# Altium schematic sheet MCU, 3.3V LDO & SUPPORT.SchDoc
size A; SheetNumber: 1; SheetTotal: 5
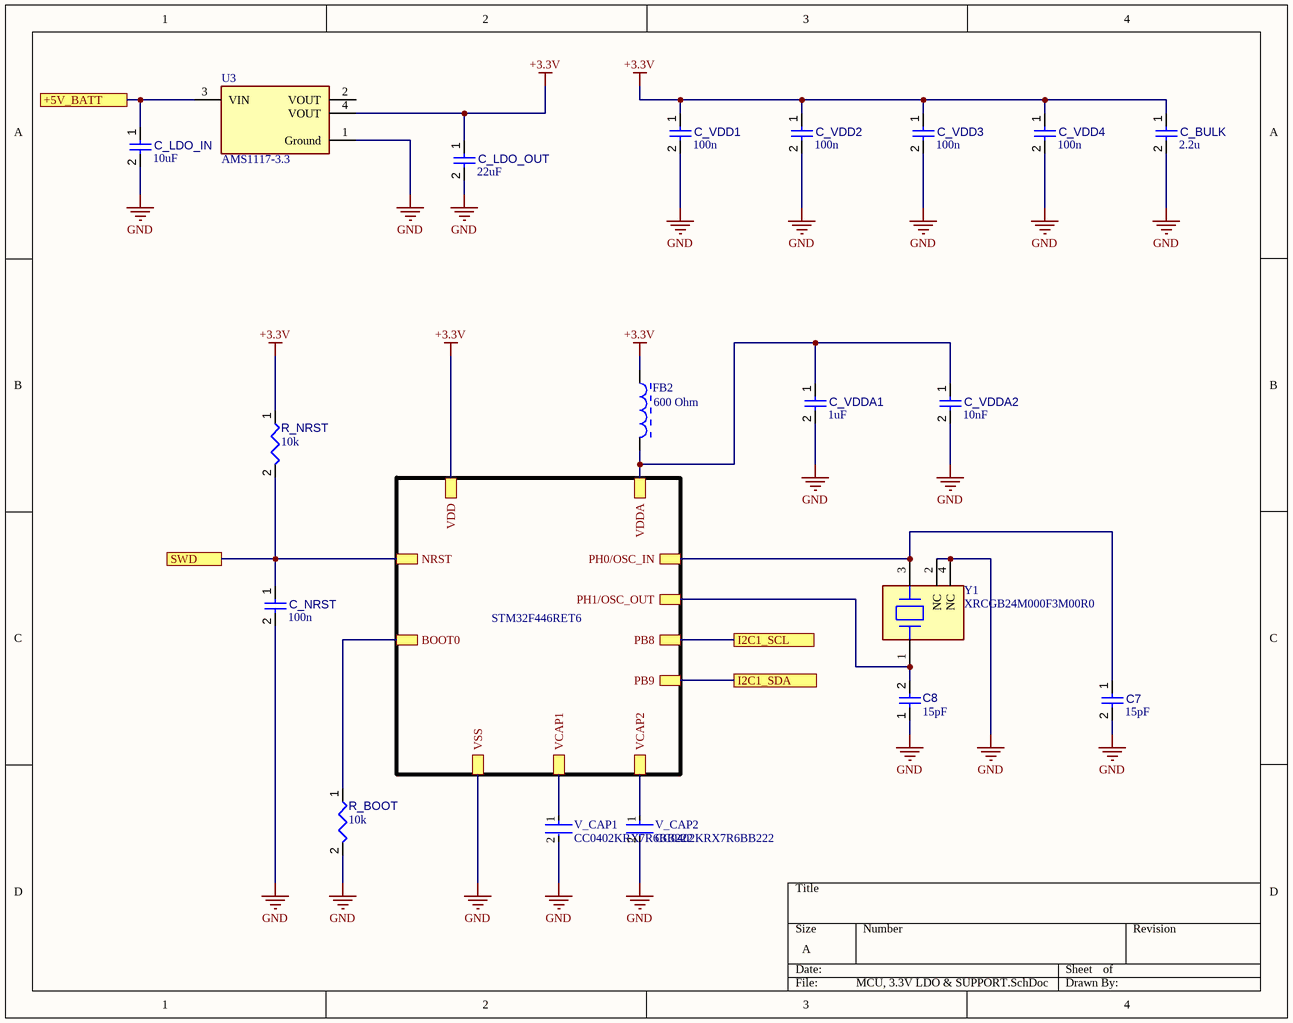
[diagram p0: MCU, 3.3V LDO & SUPPORT.SchDoc]

## Parts
C7  value 15pF  [CAPC1608X90X40NL10T20]  (hidden comment: Capacitor 100 nF +/-10% 50 V 0603)
C8  value 15pF  [CAPC1608X90X40NL10T20]  (hidden comment: Capacitor 100 nF +/-10% 50 V 0603)
C_BULK  value 2.2u  [CAPC1608X90X40NL10T20]  (hidden comment: Capacitor 100 nF +/-10% 50 V 0603)
C_LDO_IN  value 10uF  [CAPC1608X90X40NL10T20]  (hidden comment: Capacitor 100 nF +/-10% 50 V 0603)
C_LDO_OUT  value 22uF  [CAPC1608X90X40NL10T20]  (hidden comment: Capacitor 100 nF +/-10% 50 V 0603)
C_NRST  value 100n  [CAPC1608X90X40NL10T20]  (hidden comment: Capacitor 100 nF +/-10% 50 V 0603)
C_VDD1  value 100n  [CAPC1608X90X40NL10T20]  (hidden comment: Capacitor 100 nF +/-10% 50 V 0603)
C_VDD2  value 100n  [CAPC1608X90X40NL10T20]  (hidden comment: Capacitor 100 nF +/-10% 50 V 0603)
C_VDD3  value 100n  [CAPC1608X90X40NL10T20]  (hidden comment: Capacitor 100 nF +/-10% 50 V 0603)
C_VDD4  value 100n  [CAPC1608X90X40NL10T20]  (hidden comment: Capacitor 100 nF +/-10% 50 V 0603)
C_VDDA1  value 1uF  [CAPC1608X90X40NL10T20]  (hidden comment: Capacitor 100 nF +/-10% 50 V 0603)
C_VDDA2  value 10nF  [CAPC1608X90X40NL10T20]  (hidden comment: Capacitor 100 nF +/-10% 50 V 0603)
FB2  Resistance: 600 Ohm  [MURA-BLM18-F-H1-CHIP-2_V]  (hidden comment: BLM18AG121SN1D)
R_BOOT  10k  [RESC0402(1005)_L]
R_NRST  10k  [RESC0402(1005)_L]
U3  AMS1117-3.3  [FP-AMS1117-IPC_C]
V_CAP1  CC0402KRX7R6BB222  [FP-CC0402-MFG]
V_CAP2  CC0402KRX7R6BB222  [FP-CC0402-MFG]
Y1  XRCGB24M000F3M00R0  [FP-XRCGB_F_N-MFG]

## Sub-sheets
STM32F446RET6 = MCU Core.SchDoc: VDD, VSS, VCAP1, VCAP2, BOOT0, NRST, VDDA, PH0/OSC_IN, PH1/OSC_OUT, PB8, PB9

## Ports
+5V_BATT, I2C1_SCL, I2C1_SDA, SWD

## Nets
+3.3V: C_BULK.1 C_LDO_OUT.1 C_VDD1.1 C_VDD2.1 C_VDD3.1 C_VDD4.1 FB2.1 R_NRST.1 U3.4(VOUT) ; sheet STM32F446RET6/VDD
GND: C7.2 C8.1 C_BULK.2 C_LDO_IN.2 C_LDO_OUT.2 C_NRST.2 C_VDD1.2 C_VDD2.2 C_VDD3.2 C_VDD4.2 C_VDDA1.2 C_VDDA2.2 R_BOOT.2 U3.1(Ground) V_CAP1.2 V_CAP2.2 Y1.2(NC) Y1.4(NC) ; sheet STM32F446RET6/VSS
+5V_BATT: C_LDO_IN.1 U3.3(VIN) ; port +5V_BATT
I2C1_SCL: port I2C1_SCL, sheet STM32F446RET6/PB8
I2C1_SDA: port I2C1_SDA, sheet STM32F446RET6/PB9
SWD: C_NRST.1 R_NRST.2 ; port SWD, sheet STM32F446RET6/NRST
NetC7_1: C7.1 Y1.3(2_Input/Output) ; sheet STM32F446RET6/PH0/OSC_IN
NetC8_2: C8.2 Y1.1(1_Input/Output) ; sheet STM32F446RET6/PH1/OSC_OUT
NetC_VDDA1_1: C_VDDA1.1 C_VDDA2.1 FB2.2 ; sheet STM32F446RET6/VDDA
NetR_BOOT_1: R_BOOT.1 ; sheet STM32F446RET6/BOOT0
NetV_CAP1_1: V_CAP1.1 ; sheet STM32F446RET6/VCAP1
NetV_CAP2_1: V_CAP2.1 ; sheet STM32F446RET6/VCAP2

Not connected (* = marked no-connect by the designer): U3 2(VOUT)

## Library data of the parts
C7 C8 C_BULK C_LDO_IN C_LDO_OUT C_NRST C_VDD1-C_VDD4 C_VDDA1 C_VDDA2 = CMP-001-00017-6: Chip Capacitor, 100 nF, +/- 10%, 50 V, 0603 (1608 Metric); Voltage Rating: 50V; Capacitor Type: Ceramic; Tolerance: 10%; Mounting Technology: SM; Max Operating Temperature: 125°C; RoHS Compliant: True; Pins: 2; Case/Package: 0603; Min Operating Temperature: -55°C
FB2 = CMP-006-00004-3: Chip Ferrite Bead for General Use, 120 Ohm, 500 mA, -55 to 125 degC, 0603 (1608 Metric), RoHS, Tape and Reel; Manufacturer: Murata; Max Current Rating: 500mA; Tolerance: 25%; Impedance: 120Ohm; Min Operating Temperature: -55°C; Package Reference: BLM18_H950-2; Max Operating Temperature: 125°C; Current Rating: 500mA; Core Material: Ferrite; Datasheet Version: Jun-12; Packaging: TapeandReel; Datasheet URL: https://statics3.seeedstudio.com/images/opl/datasheet/303010016.pdf; Package Quantity: 4000; Case/Package: 0603; RoHS Compliant: True
R_BOOT R_NRST = CMP-009-00065-2: 100R 0.063W 1% 0402 (1005 Metric)  SMD; Power: 63mW; Tolerance: 1%; Case/Package: 0402; Pins: 2; Mounting Technology: SMT
U3 = CMP-209535-000001-1: LDO Voltage Regulators 1A, 3.3V; Manufacturer: Advanced Monolithic Systems; Dropout Voltage: 1.1V; Output Type: Fixed; Nominal Supply Current: 5mA; Max Power Dissipation: 1.2W; Max Supply Voltage: 15V; Number Of Outputs: 1; Standoff Height: 0.64mm; Max Junction Temp: +125°C; Height: 1.8mm; Package: AMS1117; Device Class L2: Power Management ICs; ComponentLink2Description: Datasheet; ComponentLink2URL: http://www.advanced-monolithic.com/pdf/ds1117.pdf; Category: IC; RoHS: TRUE; Automotive: No; Device Class L1: Integrated Circuits (ICs); Output Current: 1A; Device Class L3: Voltage Regulators - Linear; Temperature: -40°C to +125°C; Output Voltage: 3.3V; Manufacturer Part Number: AMS1117-3.3; Temperature Range Low: -40°C; Octopart: https://octopart.com/ams1117-3.3-advanced+monolithic+systems-25899300; Lead Free: Yes; Ipc Land Pattern Name: SOT229P700X180-4; Temperature Range High: +125°C
V_CAP1 V_CAP2 = CMP-03422-000888-1: CAP CER 2200PF 10V X7R 0402; Manufacturer: YAGEO; Capacitance: 2.2 nF; Value: 2.2 nF; Automotive Grade: NA; Tolerance: 0.1; Temperature Coefficient: 30ppm/°C; ComponentLink2Description: Datasheet; ComponentLink2URL: http://www.yageo.com/documents/recent/UPY-GP_NP0_16V-to-50V_16.pdf; Octopart: https://octopart.com/cc0402krx7r6bb222-yageo-71334368; Temperature: -55°C to +125°C; Ipc Land Pattern Name: CAPC10050X50; Temperature Range High: +125°C; Footprint Url: http://www.yageo.com/exep/pages/download/literatures/UPY-C_GEN_24.pdf; RoHS: TRUE; Package: CC0402; Material: Ceramic; Temperature Range Low: -55°C; Category: Cap; Device Class L3: Ceramic Capacitors; Manufacturer Part Number: CC0402KRX7R6BB222; Height: 0.55mm; Lead Free: Yes; Digikey Description: CAP CER 2200PF 10V X7R 0402; Automotive: No; Voltage Rating: 10 V; Device Class L1: Passive Components; Temperature Characteristic: X7R; Device Class L2: Capacitors
Y1 = CMP-06054-000017-1: CRYSTAL 24.0000MHZ 6PF SMD; ESR (Equivalent Series Resistance): 150R; Operating Frequency: 24 MHz; Tolerance: 30ppm; Frequency: 24MHz; Frequency Stability: 40ppm; Length: 2mm; Height: 0.028inch; Lead Free: Lead Free; Min Operating Temperature: -30°C; REACH SVHC: No SVHC; RoHS Compliant: Yes; Series Resistance: 150R; Mount: Surface Mount; Packaging: Tape and Reel; Termination: SMD/SMT; Case/Package: SMD/SMT; Max Operating Temperature: 85°C; Width: 1.6mm; Number of Pins: 4; Load Capacitance: 6pF; Package Quantity: 1; Depth: 1.6mm; Frequency Tolerance: 30ppm; Series: XRCGB